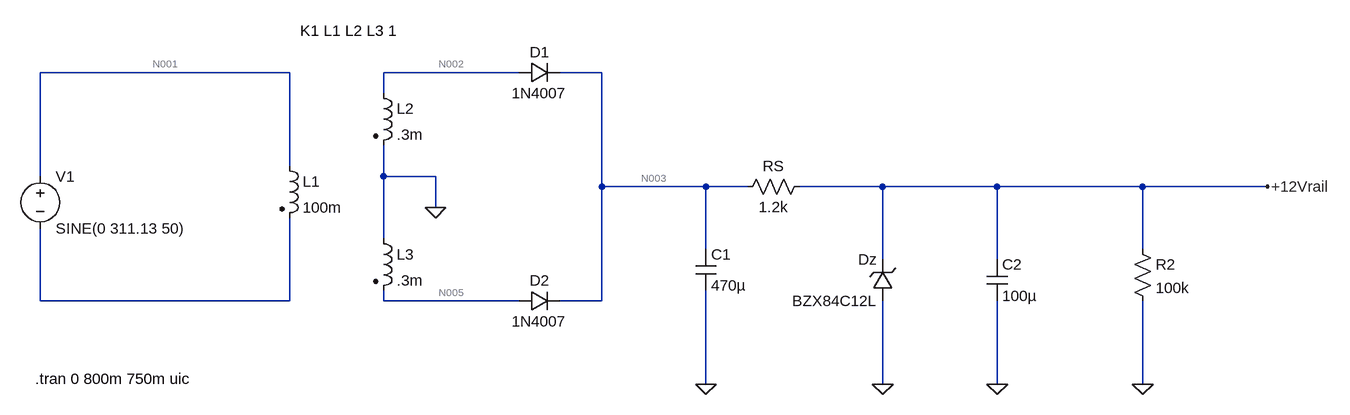
[diagram p0: schematic 3.1.asc]
3.1.asc, the LTspice schematic file:
Version 4.1
SHEET 1 2024 704
WIRE 400 16 16 16
WIRE 752 16 544 16
WIRE 880 16 816 16
WIRE 544 48 544 16
WIRE 400 160 400 16
WIRE 16 176 16 16
WIRE 544 176 544 128
WIRE 624 176 544 176
WIRE 880 192 880 16
WIRE 1040 192 880 192
WIRE 1104 192 1040 192
WIRE 1312 192 1184 192
WIRE 1488 192 1312 192
WIRE 1712 192 1488 192
WIRE 1904 192 1712 192
WIRE 624 224 624 176
WIRE 544 272 544 176
WIRE 1040 288 1040 192
WIRE 1712 288 1712 192
WIRE 1312 304 1312 192
WIRE 1488 304 1488 192
WIRE 16 368 16 256
WIRE 400 368 400 240
WIRE 400 368 16 368
WIRE 544 368 544 352
WIRE 752 368 544 368
WIRE 880 368 880 192
WIRE 880 368 816 368
WIRE 1040 496 1040 352
WIRE 1312 496 1312 368
WIRE 1488 496 1488 368
WIRE 1712 496 1712 368
FLAG 624 224 0
FLAG 1040 496 0
FLAG 1312 496 0
FLAG 1488 496 0
FLAG 1712 496 0
FLAG 1904 192 +12Vrail
SYMBOL voltage 16 160 R0
WINDOW 123 0 0 Left 0
WINDOW 39 0 0 Left 0
SYMATTR InstName V1
SYMATTR Value SINE(0 311.13 50)
SYMBOL ind2 384 144 R0
SYMATTR InstName L1
SYMATTR Value 100m
SYMATTR Type ind
SYMATTR SpiceLine Rser=1m
SYMBOL ind2 528 32 R0
SYMATTR InstName L2
SYMATTR Value .3m
SYMATTR Type ind
SYMATTR SpiceLine Rser=1m
SYMBOL ind2 528 256 R0
SYMATTR InstName L3
SYMATTR Value .3m
SYMATTR Type ind
SYMATTR SpiceLine Rser=1m
SYMBOL diode 752 32 R270
WINDOW 0 32 32 VTop 2
WINDOW 3 0 32 VBottom 2
SYMATTR InstName D1
SYMATTR Value 1N4007
SYMBOL diode 752 384 R270
WINDOW 0 32 32 VTop 2
WINDOW 3 0 32 VBottom 2
SYMATTR InstName D2
SYMATTR Value 1N4007
SYMBOL cap 1024 288 R0
SYMATTR InstName C1
SYMATTR Value 470µ
SYMBOL res 1200 176 R90
WINDOW 0 0 56 VBottom 2
WINDOW 3 32 56 VTop 2
SYMATTR InstName RS
SYMATTR Value 1.2k
SYMBOL zener 1328 368 R180
WINDOW 0 24 64 Left 2
WINDOW 3 24 0 Left 2
SYMATTR InstName Dz
SYMATTR Value BZX84C12L
SYMBOL cap 1472 304 R0
SYMATTR InstName C2
SYMATTR Value 100µ
SYMBOL res 1696 272 R0
SYMATTR InstName R2
SYMATTR Value 100k
TEXT 416 -48 Left 2 !K1 L1 L2 L3 1
TEXT 8 488 Left 2 !.tran 0 800m 750m uic

The netlist it stands for:
* 3.1.asc
V1 N001 N004 SINE(0 311.13 50)
L1 N001 N004 100m Rser=1m
L2 N002 0 .3m Rser=1m
L3 0 N005 .3m Rser=1m
D1 N002 N003 1N4007
D2 N005 N003 1N4007
C1 N003 0 470µ
RS +12Vrail N003 1.2k
Dz 0 +12Vrail BZX84C12L
C2 +12Vrail 0 100µ
R2 +12Vrail 0 100k
.model D D
.lib standard.dio
K1 L1 L2 L3 1
.tran 0 800m 750m uic
.backanno
.end

* Results of the author's LTspice run, read from the files saved beside the schematic
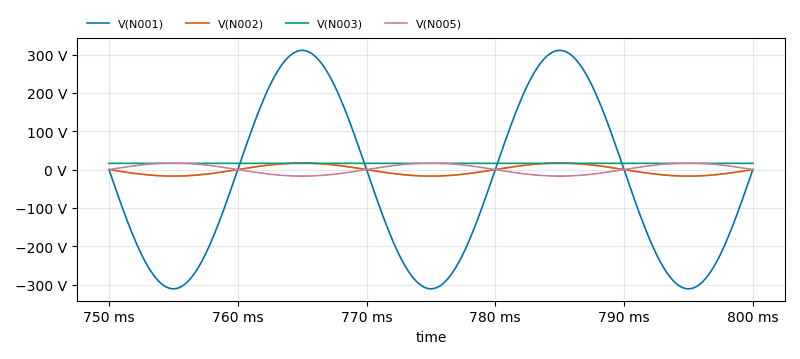
[diagram p1: Transient Analysis of 3.1.asc, plotted from the saved traces]
* Transient Analysis, 1 run:
*   V(N001): min -311.1 V, max 311.1 V, average -39.6 V, rms 220 V, last 0 V
*   V(N002): min -17.04 V, max 17.04 V, average -2.17 V, rms 12.05 V, last 5.892 µV
*   V(N003): min 16.25 V, max 16.31 V, average 16.28 V, rms 16.28 V, last 16.28 V
*   V(N005): min -17.04 V, max 17.04 V, average 2.17 V, rms 12.05 V, last -5.612 µV